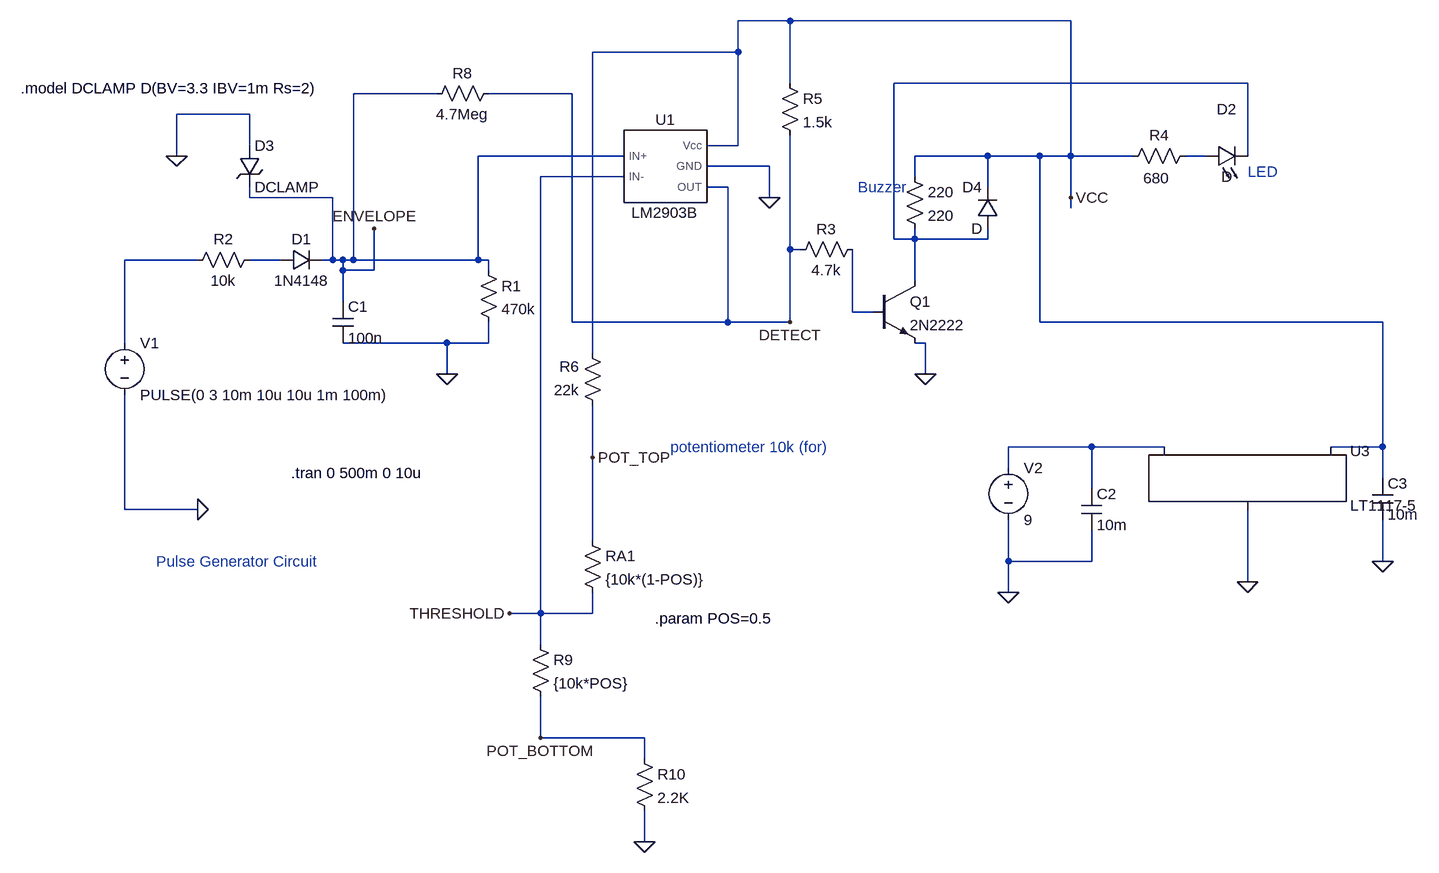
[diagram p0: schematic 09_final_ignition_coil_detector.asc]
09_final_ignition_coil_detector.asc, the LTspice schematic file:
Version 4.1
SHEET 1 1976 944
WIRE 992 -368 912 -368
WIRE 1424 -368 992 -368
WIRE 912 -320 912 -368
WIRE 912 -320 688 -320
WIRE 992 -272 992 -368
WIRE 1696 -272 1152 -272
WIRE 448 -256 320 -256
WIRE 656 -256 528 -256
WIRE 160 -224 48 -224
WIRE 160 -176 160 -224
WIRE 912 -176 912 -320
WIRE 912 -176 864 -176
WIRE 48 -160 48 -224
WIRE 736 -160 512 -160
WIRE 1296 -160 1184 -160
WIRE 1376 -160 1296 -160
WIRE 1424 -160 1424 -368
WIRE 1424 -160 1376 -160
WIRE 1520 -160 1424 -160
WIRE 1632 -160 1600 -160
WIRE 1696 -160 1696 -272
WIRE 960 -144 864 -144
WIRE 736 -128 608 -128
WIRE 1184 -128 1184 -160
WIRE 896 -112 864 -112
WIRE 1296 -112 1296 -160
WIRE 160 -96 160 -112
WIRE 288 -96 160 -96
WIRE 960 -96 960 -144
WIRE 1424 -96 1424 -160
WIRE 1424 -80 1424 -96
WIRE 1152 -32 1152 -272
WIRE 1184 -32 1184 -48
WIRE 1184 -32 1152 -32
WIRE 1296 -32 1296 -48
WIRE 1296 -32 1184 -32
WIRE 992 -16 992 -192
WIRE 1008 -16 992 -16
WIRE 80 0 -32 0
WIRE 208 0 160 0
WIRE 288 0 288 -96
WIRE 288 0 272 0
WIRE 304 0 288 0
WIRE 320 0 320 -256
WIRE 320 0 304 0
WIRE 512 0 512 -160
WIRE 512 0 320 0
WIRE 528 0 512 0
WIRE 304 16 304 0
WIRE 352 16 352 -48
WIRE 352 16 304 16
WIRE 528 16 528 0
WIRE 1184 32 1184 -32
WIRE 304 64 304 16
WIRE 1088 80 1088 -16
WIRE 1120 80 1088 80
WIRE 656 96 656 -256
WIRE 896 96 896 -112
WIRE 896 96 656 96
WIRE 992 96 992 -16
WIRE 992 96 896 96
WIRE 1376 96 1376 -160
WIRE 1904 96 1376 96
WIRE -32 128 -32 0
WIRE 464 128 304 128
WIRE 528 128 528 96
WIRE 528 128 464 128
WIRE 1200 128 1184 128
WIRE 688 144 688 -320
WIRE 464 176 464 128
WIRE 1200 176 1200 128
WIRE 1456 288 1328 288
WIRE 1568 288 1456 288
WIRE 1904 288 1904 96
WIRE 1904 288 1824 288
WIRE 688 304 688 224
WIRE 1328 320 1328 288
WIRE 1904 336 1904 288
WIRE 1456 352 1456 288
WIRE -32 384 -32 208
WIRE 80 384 -32 384
WIRE 688 432 688 304
WIRE 1328 464 1328 400
WIRE 1456 464 1456 416
WIRE 1456 464 1328 464
WIRE 1904 464 1904 400
WIRE 1696 496 1696 384
WIRE 1328 512 1328 464
WIRE 608 544 608 -128
WIRE 608 544 560 544
WIRE 688 544 688 512
WIRE 688 544 608 544
WIRE 608 592 608 544
WIRE 608 736 608 672
WIRE 768 736 608 736
WIRE 768 768 768 736
WIRE 768 896 768 848
FLAG 80 384 0
FLAG 464 176 0
FLAG 352 -48 ENVELOPE
FLAG 1424 -96 VCC
FLAG 1200 176 0
FLAG 960 -96 0
FLAG 992 96 DETECT
FLAG 560 544 THRESHOLD
FLAG 48 -160 0
FLAG 1328 512 0
FLAG 1904 464 0
FLAG 1696 496 0
FLAG 688 304 POT_TOP
FLAG 608 736 POT_BOTTOM
FLAG 768 896 0
SYMBOL voltage -32 112 R0
WINDOW 123 0 0 Left 0
WINDOW 39 0 0 Left 0
SYMATTR InstName V1
SYMATTR Value PULSE(0 3 10m 10u 10u 1m 100m)
SYMBOL res 176 -16 R90
WINDOW 0 0 56 VBottom 2
WINDOW 3 32 56 VTop 2
SYMATTR InstName R2
SYMATTR Value 10k
SYMBOL diode 208 16 R270
WINDOW 0 32 32 VTop 2
WINDOW 3 0 32 VBottom 2
SYMATTR InstName D1
SYMATTR Value 1N4148
SYMBOL cap 288 64 R0
SYMATTR InstName C1
SYMATTR Value 100n
SYMBOL res 512 0 R0
SYMATTR InstName R1
SYMATTR Value 470k
SYMBOL npn 1120 32 R0
SYMATTR InstName Q1
SYMATTR Value 2N2222
SYMBOL res 1104 -32 R90
WINDOW 0 0 56 VBottom 2
WINDOW 3 32 56 VTop 2
SYMATTR InstName R3
SYMATTR Value 4.7k
SYMBOL res 1168 -144 R0
SYMATTR InstName 220
SYMATTR Value 220
SYMBOL res 1616 -176 R90
WINDOW 0 0 56 VBottom 2
WINDOW 3 35 60 VTop 2
SYMATTR InstName R4
SYMATTR Value 680
SYMBOL LED 1632 -144 R270
WINDOW 0 72 32 VTop 2
WINDOW 3 0 32 VBottom 2
SYMATTR InstName D2
SYMBOL LM2903B 800 -144 R0
SYMATTR InstName U1
SYMBOL res 976 -288 R0
SYMATTR InstName R5
SYMATTR Value 1.5k
SYMBOL res 704 240 R180
WINDOW 0 36 76 Left 2
WINDOW 3 36 40 Left 2
SYMATTR InstName R6
SYMATTR Value 22k
SYMBOL res 544 -272 R90
WINDOW 0 0 56 VBottom 2
WINDOW 3 32 56 VTop 2
SYMATTR InstName R8
SYMATTR Value 4.7Meg
SYMBOL zener 144 -176 R0
SYMATTR InstName D3
SYMATTR Value DCLAMP
SYMBOL diode 1312 -48 R180
WINDOW 0 24 64 Left 2
WINDOW 3 24 0 Left 2
SYMATTR InstName D4
SYMBOL PowerProducts\\LT1117-5 1696 288 R0
SYMATTR InstName U3
SYMBOL voltage 1328 304 R0
WINDOW 123 0 0 Left 0
WINDOW 39 0 0 Left 0
SYMATTR InstName V2
SYMATTR Value 9
SYMBOL cap 1440 352 R0
SYMATTR InstName C2
SYMATTR Value 10m
SYMBOL cap 1888 336 R0
SYMATTR InstName C3
SYMATTR Value 10m
SYMBOL res 672 416 R0
SYMATTR InstName RA1
SYMATTR Value {10k*(1-POS)}
SYMBOL res 592 576 R0
SYMATTR InstName R9
SYMATTR Value {10k*POS}
SYMBOL res 752 752 R0
SYMATTR InstName R10
SYMATTR Value 2.2K
TEXT 224 328 Left 2 !.tran 0 500m 0 10u
TEXT 16 464 Left 2 ;Pulse Generator Circuit
TEXT 1096 -112 Left 2 ;Buzzer
TEXT 1696 -136 Left 2 ;LED
TEXT -192 -264 Left 2 !.model DCLAMP D(BV=3.3 IBV=1m Rs=2)
TEXT 808 288 Left 2 ;potentiometer 10k (for)
TEXT 784 552 Left 2 !.param POS=0.5

The netlist it stands for:
* 09_final_ignition_coil_detector.asc
V1 N003 0 PULSE(0 3 10m 10u 10u 1m 100m)
R2 N004 N003 10k
D1 N004 ENVELOPE 1N4148
C1 ENVELOPE 0 100n
R1 ENVELOPE 0 470k
Q1 N001 N005 0 0 2N2222
R3 N005 DETECT 4.7k
R§220 VCC N001 220
R4 N002 VCC 680
D2 N002 N001 D
X§U1 ENVELOPE THRESHOLD VCC 0 DETECT LM2903B  ; pins IN+ IN- Vcc GND OUT
R5 VCC DETECT 1.5k
R6 POT_TOP VCC 22k
R8 DETECT ENVELOPE 4.7Meg
D3 0 ENVELOPE DCLAMP
D4 N001 VCC D
X§U3 0 VCC N006 LT1117-5
V2 N006 0 9
C2 N006 0 10m
C3 VCC 0 10m
RA1 POT_TOP THRESHOLD {10k*(1-POS)}
R9 THRESHOLD POT_BOTTOM {10k*POS}
R10 POT_BOTTOM 0 2.2K
.model D D
.lib standard.dio
.model NPN NPN
.model PNP PNP
.lib standard.bjt
.tran 0 500m 0 10u
* Pulse Generator Circuit
* Buzzer
* LED
.model DCLAMP D(BV=3.3 IBV=1m Rs=2)
* potentiometer 10k (for)
.param POS=0.5
.lib lm393.lib
.backanno
.end